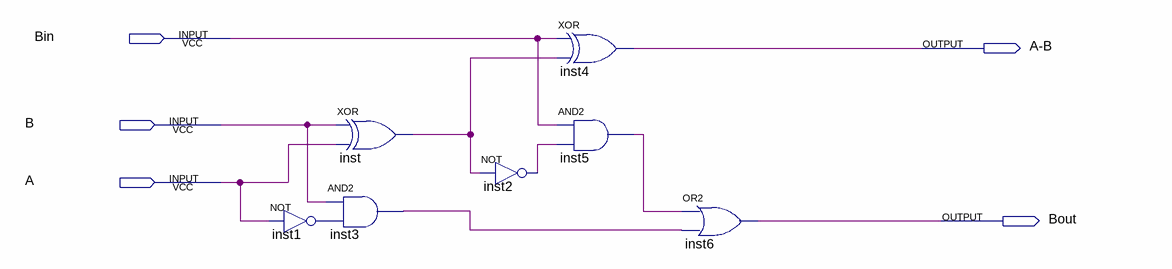
[diagram p0: schematic sheet]
// Quartus schematic aula07.bdf as structural Verilog: 7 symbols, 5 pins
module aula07 (
  input  Bin,
  input  B,
  input  A,
  output \A-B ,
  output Bout
);

  wire inst1_out, inst2_out, inst3_out, inst5_out, inst_out;

  not inst1 (inst1_out, A);
  xor inst (inst_out, B, A);
  and inst3 (inst3_out, B, inst1_out);
  not inst2 (inst2_out, inst_out);
  xor inst4 (\A-B , Bin, inst_out);
  and inst5 (inst5_out, Bin, inst2_out);
  or inst6 (Bout, inst5_out, inst3_out);
endmodule
